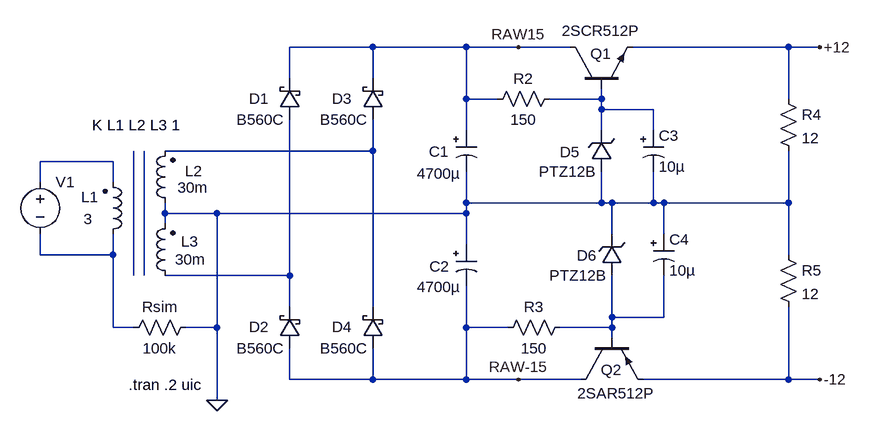
[diagram p0: schematic transformer_dual.asc]
transformer_dual.asc, the LTspice schematic file:
Version 4
SHEET 1 992 680
WIRE 208 -256 80 -256
WIRE 352 -256 208 -256
WIRE 432 -256 352 -256
WIRE 512 -256 432 -256
WIRE 848 -256 608 -256
WIRE 896 -256 848 -256
WIRE 80 -208 80 -256
WIRE 208 -208 208 -256
WIRE 352 -176 352 -256
WIRE 400 -176 352 -176
WIRE 560 -176 560 -192
WIRE 560 -176 480 -176
WIRE 848 -176 848 -256
WIRE 560 -160 560 -176
WIRE 640 -160 560 -160
WIRE 352 -128 352 -176
WIRE 560 -128 560 -160
WIRE 640 -128 640 -160
WIRE 208 -96 208 -144
WIRE 208 -96 -112 -96
WIRE -192 -80 -304 -80
WIRE -304 -48 -304 -80
WIRE -192 -48 -192 -80
WIRE 352 -16 352 -64
WIRE 560 -16 560 -64
WIRE 560 -16 352 -16
WIRE 576 -16 560 -16
WIRE 640 -16 640 -64
WIRE 640 -16 576 -16
WIRE 656 -16 640 -16
WIRE 848 -16 848 -96
WIRE 848 -16 656 -16
WIRE -112 0 -112 -16
WIRE -32 0 -112 0
WIRE 352 0 352 -16
WIRE 352 0 -32 0
WIRE -112 16 -112 0
WIRE 576 32 576 -16
WIRE 656 32 656 -16
WIRE 352 48 352 0
WIRE -304 64 -304 32
WIRE -192 64 -192 32
WIRE -192 64 -304 64
WIRE 848 64 848 -16
WIRE -160 96 -160 -96
WIRE -144 96 -144 -96
WIRE 80 96 80 -144
WIRE 80 96 -112 96
WIRE 80 144 80 96
WIRE 208 144 208 -96
WIRE 576 160 576 96
WIRE 656 160 656 96
WIRE 656 160 576 160
WIRE -192 176 -192 64
WIRE -160 176 -192 176
WIRE -32 176 -32 0
WIRE -32 176 -80 176
WIRE 352 176 352 112
WIRE 416 176 352 176
WIRE 576 176 576 160
WIRE 576 176 496 176
WIRE 576 192 576 176
WIRE 80 256 80 208
WIRE 208 256 208 208
WIRE 208 256 80 256
WIRE 352 256 352 176
WIRE 352 256 208 256
WIRE 432 256 352 256
WIRE 528 256 432 256
WIRE 848 256 848 144
WIRE 848 256 624 256
WIRE 896 256 848 256
WIRE -32 288 -32 176
FLAG -32 288 0
FLAG 896 -256 +12
FLAG 896 256 -12
FLAG 432 -256 RAW15
FLAG 432 256 RAW-15
SYMBOL ind2 -208 48 M180
WINDOW 0 -33 73 Left 2
WINDOW 3 -29 39 Left 2
SYMATTR InstName L1
SYMATTR Value 3
SYMATTR Type ind
SYMATTR SpiceLine Rser=1
SYMBOL ind2 -96 112 R180
WINDOW 0 -36 69 Left 2
WINDOW 3 -47 41 Left 2
SYMATTR InstName L3
SYMATTR Value 30m
SYMATTR Type ind
SYMBOL ind2 -96 0 R180
WINDOW 0 -42 65 Left 2
WINDOW 3 -51 40 Left 2
SYMATTR InstName L2
SYMATTR Value 30m
SYMATTR Type ind
SYMBOL schottky 96 -144 R180
WINDOW 0 48 33 Left 2
WINDOW 3 24 0 Left 2
SYMATTR InstName D1
SYMATTR Value B560C
SYMATTR Description Diode
SYMATTR Type diode
SYMBOL schottky 96 208 R180
WINDOW 0 48 33 Left 2
WINDOW 3 24 0 Left 2
SYMATTR InstName D2
SYMATTR Value B560C
SYMATTR Description Diode
SYMATTR Type diode
SYMBOL res -64 160 R90
WINDOW 0 0 56 VBottom 2
WINDOW 3 32 56 VTop 2
SYMATTR InstName Rsim
SYMATTR Value 100k
SYMBOL schottky 224 -144 R180
WINDOW 0 48 33 Left 2
WINDOW 3 24 0 Left 2
SYMATTR InstName D3
SYMATTR Value B560C
SYMATTR Description Diode
SYMATTR Type diode
SYMBOL schottky 224 208 R180
WINDOW 0 48 33 Left 2
WINDOW 3 24 0 Left 2
SYMATTR InstName D4
SYMATTR Value B560C
SYMATTR Description Diode
SYMATTR Type diode
SYMBOL polcap 336 -128 R0
WINDOW 0 -42 33 Left 2
WINDOW 3 -60 67 Left 2
SYMATTR InstName C1
SYMATTR Value 4700µ
SYMBOL polcap 336 48 R0
WINDOW 0 -41 34 Left 2
WINDOW 3 -60 65 Left 2
SYMATTR InstName C2
SYMATTR Value 4700µ
SYMBOL res 496 -192 R90
WINDOW 0 0 56 VBottom 2
WINDOW 3 32 56 VTop 2
SYMATTR InstName R2
SYMATTR Value 150
SYMBOL npn 512 -192 R270
WINDOW 0 54 31 VRight 2
WINDOW 3 89 -13 VRight 2
SYMATTR InstName Q1
SYMATTR Value 2SCR512P
SYMBOL pnp 528 192 M90
WINDOW 0 49 63 VLeft 2
WINDOW 3 85 113 VLeft 2
SYMATTR InstName Q2
SYMATTR Value 2SAR512P
SYMBOL res 512 160 R90
WINDOW 0 0 56 VBottom 2
WINDOW 3 32 56 VTop 2
SYMATTR InstName R3
SYMATTR Value 150
SYMBOL res 832 -192 R0
SYMATTR InstName R4
SYMATTR Value 12
SYMBOL res 832 48 R0
SYMATTR InstName R5
SYMATTR Value 12
SYMBOL zener 576 -64 R180
WINDOW 0 49 30 Left 2
WINDOW 3 24 0 Left 2
SYMATTR InstName D5
SYMATTR Value PTZ12B
SYMBOL zener 592 96 R180
WINDOW 0 39 31 Left 2
WINDOW 3 24 0 Left 2
SYMATTR InstName D6
SYMATTR Value PTZ12B
SYMBOL polcap 624 -128 R0
SYMATTR InstName C3
SYMATTR Value 10µ
SYMBOL polcap 640 32 R0
SYMATTR InstName C4
SYMATTR Value 10µ
SYMBOL voltage -304 -64 R0
WINDOW 3 24 96 Invisible 2
WINDOW 123 0 0 Left 2
WINDOW 39 0 0 Left 2
SYMATTR InstName V1
SYMATTR Value SINE(0 170 50)
TEXT -224 -136 Left 2 !K L1 L2 L3 1
TEXT -168 264 Left 2 !.tran .2 uic

The netlist it stands for:
* transformer_dual.asc
L1 N004 N003 3 Rser=1
L3 N007 0 30m
L2 0 N002 30m
D1 N007 RAW15 B560C
D2 RAW-15 N007 B560C
Rsim 0 N004 100k
D3 N002 RAW15 B560C
D4 RAW-15 N002 B560C
C1 RAW15 0 4700µ
C2 0 RAW-15 4700µ
R2 N001 RAW15 150
Q1 RAW15 N001 +12 0 2SCR512P
Q2 RAW-15 N008 -12 0 2SAR512P
R3 N008 RAW-15 150
R4 +12 0 12
R5 0 -12 12
D5 0 N001 PTZ12B
D6 N008 0 PTZ12B
C3 N001 0 10µ
C4 0 N008 10µ
V1 N003 N004 SINE(0 170 50)
.model D D
.lib standard.dio
.model NPN NPN
.model PNP PNP
.lib standard.bjt
K L1 L2 L3 1
.tran .2 uic
.backanno
.end